# Altium schematic sheet Sheet1.SchDoc
size A; SheetNumber: 1; SheetTotal: 2
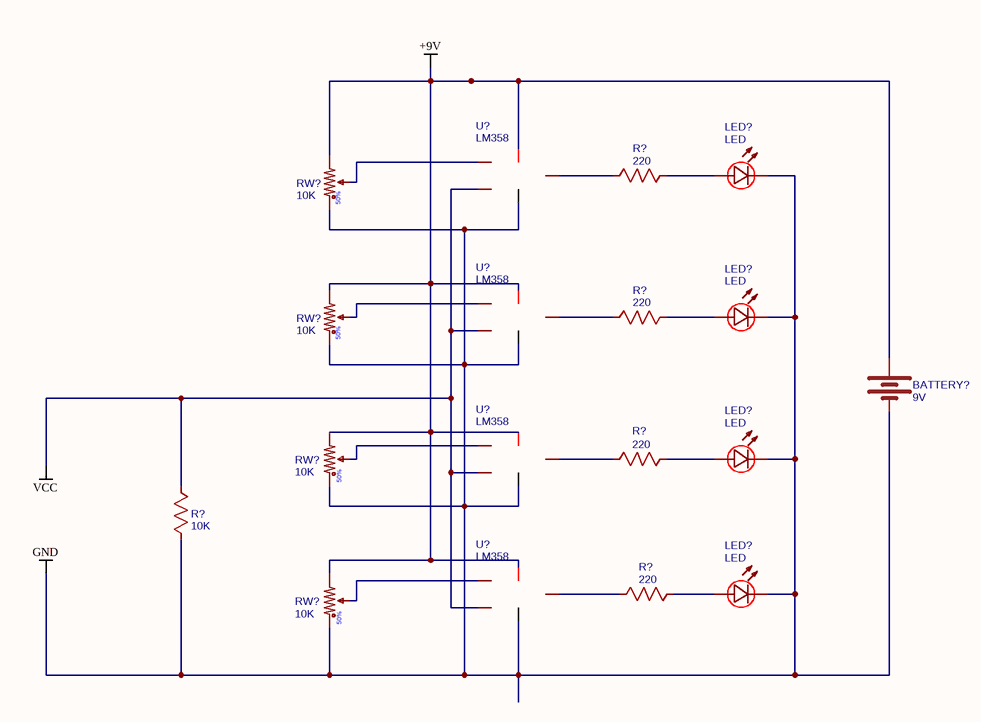
[diagram p0: Sheet1.SchDoc]

## Parts
(Parts that share a designator on the sheet are numbered #1, #2 ... from top to bottom, then left to right.)
BATTERY?  9V  [BATTCON_9V]
LED?#1  LED  [LED0603_RED]
LED?#2  LED  [LED0603_RED]
LED?#3  LED  [LED0603_RED]
LED?#4  LED  [LED0603_RED]
R?#1  220  [R3]
R?#2  220  [R3]
R?#3  220  [R3]
R?#4  10K  [R3]
R?#5  220  [R3]
RW?#1  10K  [RES-ADJ_3386P]
RW?#2  10K  [RES-ADJ_3386P]
RW?#3  10K  [RES-ADJ_3386P]
RW?#4  10K  [RES-ADJ_3386P]
U?#1  LM358  [DIP08]
U?#2  LM358  [DIP08]
U?#3  LM358  [DIP08]
U?#4  LM358  [DIP08]

## Nets
+9V: BATTERY?.+ RW?#1.3 RW?#2.3 RW?#3.3 RW?#4.3 U?#1.7(V+) U?#2.7(V+) U?#3.7(V+) U?#4.7(V+)
GND: BATTERY?.- LED?#1.2(-) LED?#2.2(-) LED?#3.2(-) LED?#4.2(-) R?#4.2 RW?#1.1 RW?#2.1 RW?#3.1 RW?#4.1 U?#1.4(V-) U?#2.4(V-) U?#3.4(V-) U?#4.4(V-)
VCC: R?#4.1 U?#1.3(IN+) U?#2.3(IN+) U?#3.3(IN+) U?#4.3(IN+)
NetLED?#1_1: LED?#1.1(+) R?#1.2
NetLED?#2_1: LED?#2.1(+) R?#2.2
NetLED?#3_1: LED?#3.1(+) R?#3.2
NetLED?#4_1: LED?#4.1(+) R?#5.2
NetR?#1_1: R?#1.1 U?#1.6(OUT)
NetR?#2_1: R?#2.1 U?#2.6(OUT)
NetR?#3_1: R?#3.1 U?#3.6(OUT)
NetR?#5_1: R?#5.1 U?#4.6(OUT)
NetRW?#1_2: RW?#1.2 U?#1.2(IN-)
NetRW?#2_2: RW?#2.2 U?#2.2(IN-)
NetRW?#3_2: RW?#3.2 U?#3.2(IN-)
NetRW?#4_2: RW?#4.2 U?#4.2(IN-)

## Notes on the sheet
- (in symbol 10K) 50%

## Library data of the parts
BATTERY? = 9V: Contributor: SparkFun; spicePre: B; spiceSymbolName: BATTERY9V
LED?#1-LED?#4 = LED: nameAlias: Model; catid: 20; Contributor: 仿真库绘制; Color: Red; sim: true; spicePre: X; spiceSymbolName: LED
R?#1-R?#3 R?#5 = 220: nameAlias: Value(Ω); timeStamp: 1454423755; spicePre: R; spiceSymbolName: Resistor
R?#4 = 10K: nameAlias: Value(Ω); timeStamp: 1454423755; spicePre: R; spiceSymbolName: Resistor
RW?#1-RW?#4 = 10K: Resistance: 100K; K: 50; sim: true; spiceSymbolName: POTENTIOMETER; spicePre: X
U?#1-U?#4 = LM358: Gbw: 1Meg; Slewrate: 1; Rin(Ω): 500Meg; Rout(Ω): 100; Ibias[A]: 1n; Isc[A]: 30m; Inhi[V]: 2; Vabsmax[V]: 36; Vmin[V]: 3; Cin[F]: 3p; Iq[A]: 200u; Contributor: EasyEDA; spicePre: X; spiceSymbolName: OPAMP5PEE; Avol: 1Meg; Inlo[V]: 2; Outhi[V]: 1; Outlo[V]: 1